# Altium schematic sheet 01_Power.SchDoc
size A3; SheetNumber: 1; SheetTotal: 6
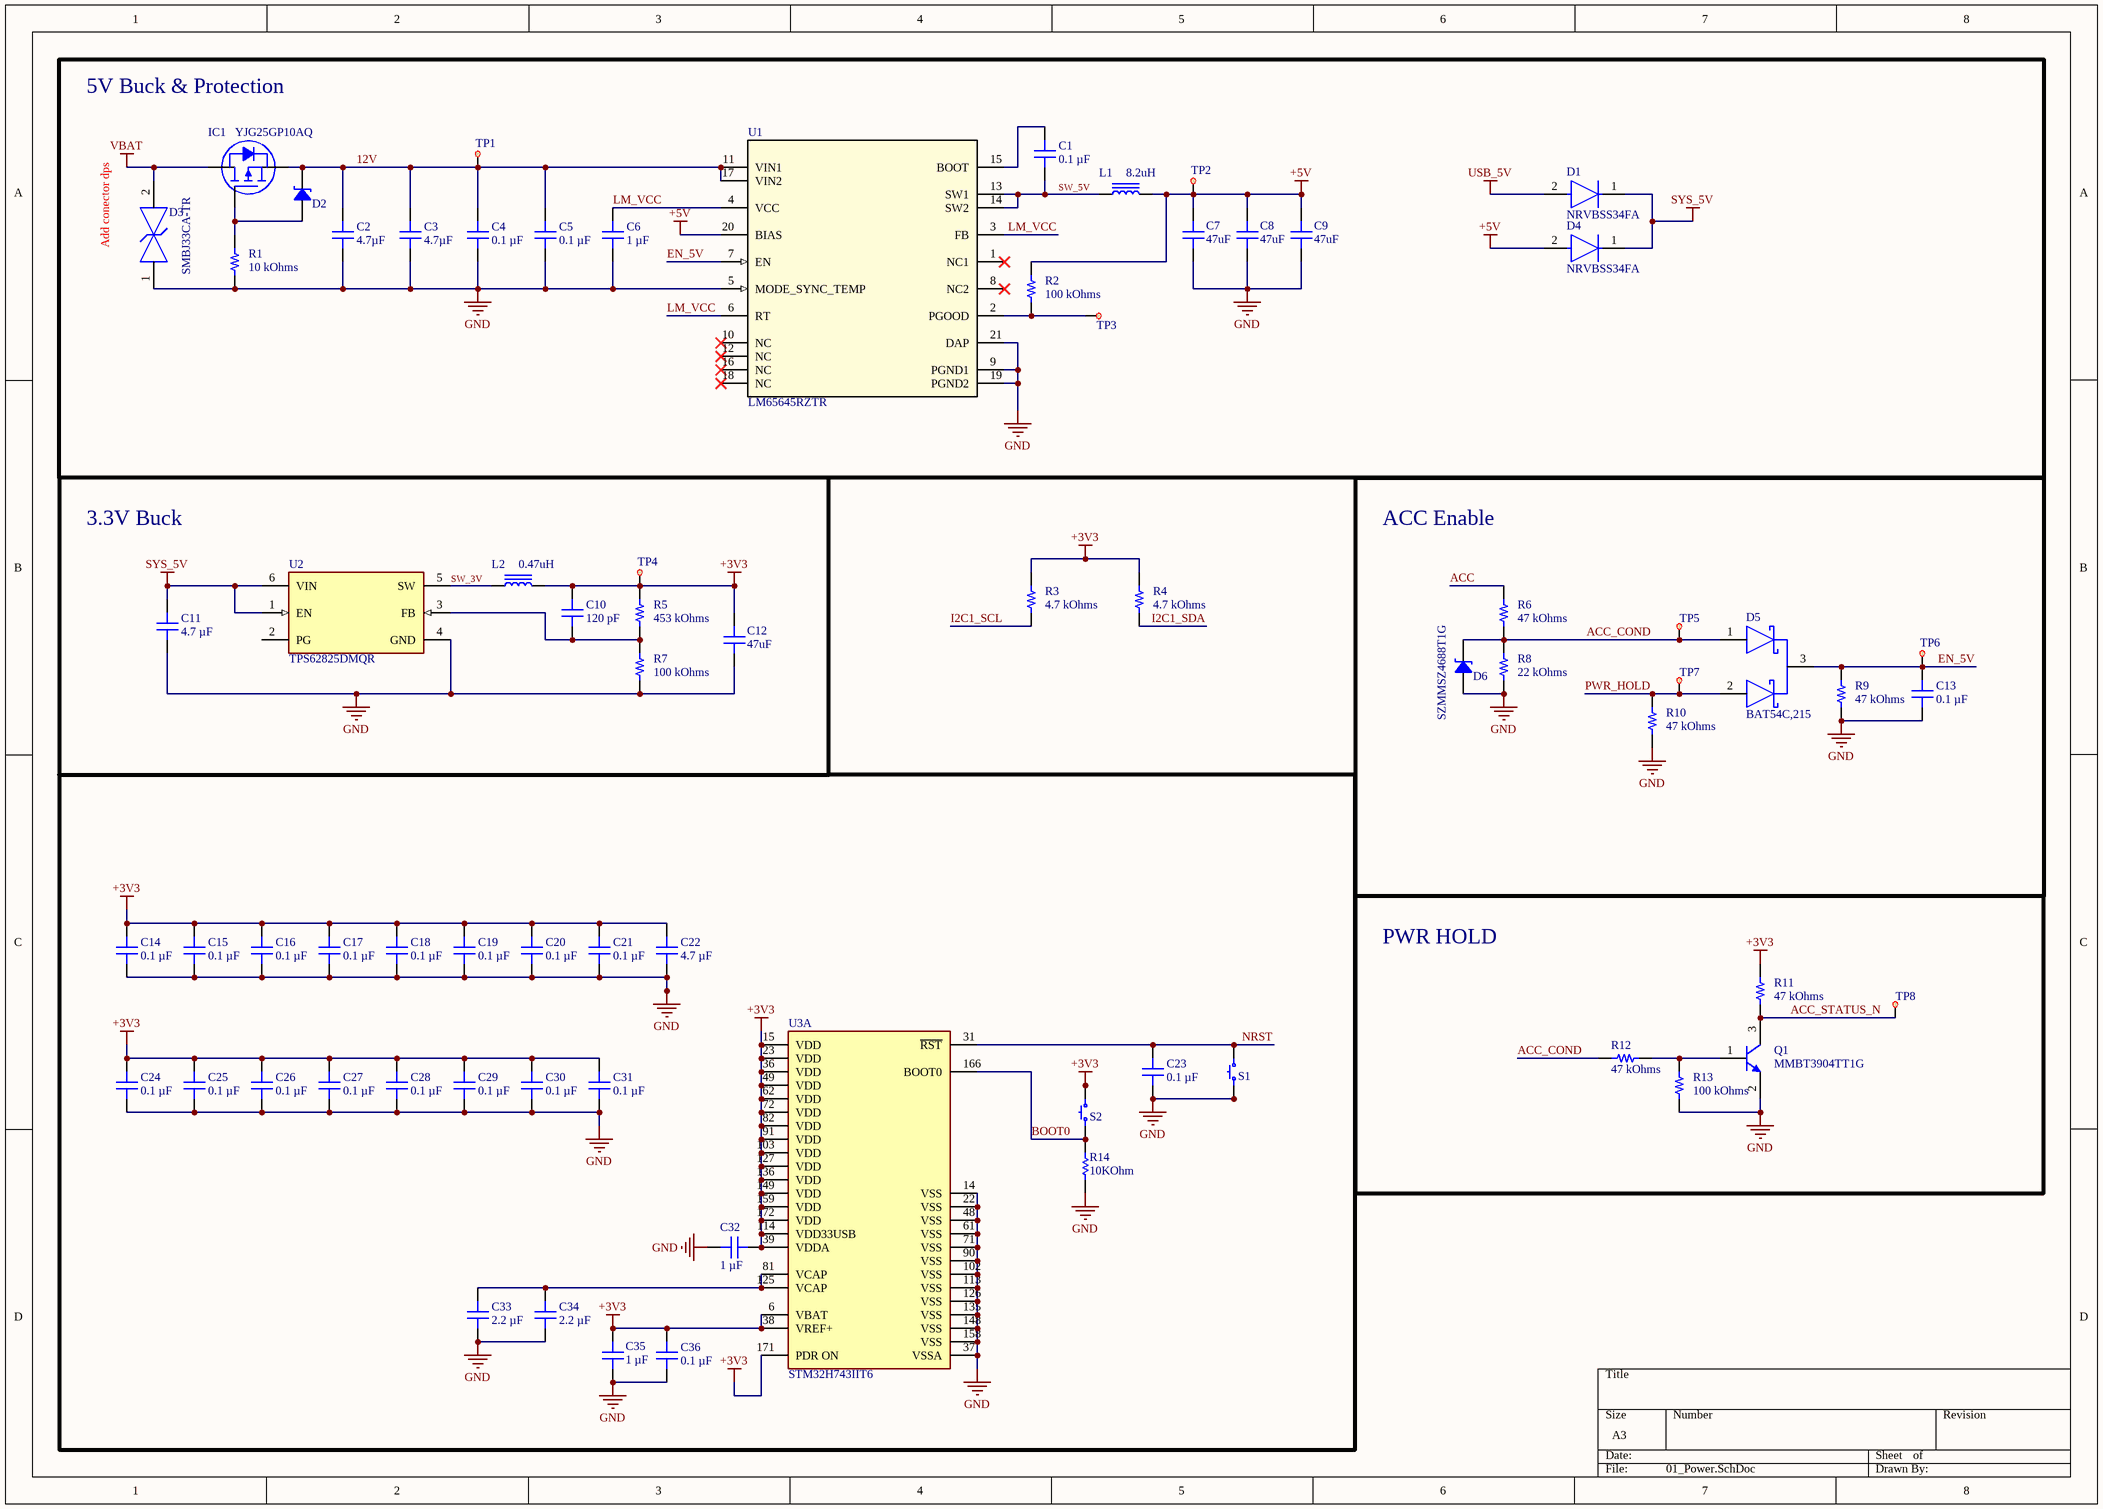
[diagram p0: 01_Power.SchDoc]

## Parts
C1  0.1 µF  [CAP 0402_1005]
C2  4.7µF  [CAP 1210_3225 - 2.8MM]
C3  4.7µF  [CAP 1210_3225 - 2.8MM]
C4  0.1 µF  [CAP 0603_1608]
C5  0.1 µF  [CAP 0603_1608]
C6  1 µF  [CAP 0603_1608]
C7  47uF  [HRE CGA1206X5R476M100NT CAPC3216X180N]
C8  47uF  [HRE CGA1206X5R476M100NT CAPC3216X180N]
C9  47uF  [HRE CGA1206X5R476M100NT CAPC3216X180N]
C10  120 pF  [CAP 0402_1005]
C11  4.7 µF  [CAP 0603_1608]
C12  47uF  [HRE CGA1206X5R476M100NT CAPC3216X180N]
C13  0.1 µF  [CAP 0402_1005]
C14  0.1 µF  [CAP 0201_0603]
C15  0.1 µF  [CAP 0201_0603]
C16  0.1 µF  [CAP 0201_0603]
C17  0.1 µF  [CAP 0201_0603]
C18  0.1 µF  [CAP 0201_0603]
C19  0.1 µF  [CAP 0201_0603]
C20  0.1 µF  [CAP 0201_0603]
C21  0.1 µF  [CAP 0201_0603]
C22  4.7 µF  [CAP 0603_1608]
C23  0.1 µF  [CAP 0201_0603]
C24  0.1 µF  [CAP 0201_0603]
C25  0.1 µF  [CAP 0201_0603]
C26  0.1 µF  [CAP 0201_0603]
C27  0.1 µF  [CAP 0201_0603]
C28  0.1 µF  [CAP 0201_0603]
C29  0.1 µF  [CAP 0201_0603]
C30  0.1 µF  [CAP 0201_0603]
C31  0.1 µF  [CAP 0201_0603]
C32  1 µF  [CAP 0603_1608]
C33  2.2 µF  [CAP 0402_1005]
C34  2.2 µF  [CAP 0402_1005]
C35  1 µF  [CAP 0603_1608]
C36  0.1 µF  [CAP 0201_0603]
D1  NRVBSS34FA  [FP-425AB-MFG]
D2  BZT52C15-TP  [SOD-123]  (value not drawn)
D3  SMBJ33CA-TR  [FP-SMB-CA-MFG]
D4  NRVBSS34FA  [FP-425AB-MFG]
D5  BAT54C,215  [FP-SOT23-MFG]
D6  SZMMSZ4688T1G  [SOD-123]
IC1  YJG25GP10AQ  [YJG25GP10AQ DFN5x6_8L_EP1_P]
L1  8.2uH  [cjiang FXL0630-8R2-M INDP7066X300N]
L2  0.47uH  [INDP2016X100N]
Q1  MMBT3904TT1G  [ON SEMICONDUCTOR SC-75]
R1  10 kOhms  [RES 0805_2012]
R2  100 kOhms  [RES 0402_1005]
R3  4.7 kOhms  [RES 0402_1005]
R4  4.7 kOhms  [RES 0402_1005]
R5  453 kOhms  [RES 0402_1005]
R6  47 kOhms  [RES 0402_1005]
R7  100 kOhms  [RES 0402_1005]
R8  22 kOhms  [RES 0402_1005]
R9  47 kOhms  [RES 0402_1005]
R10  47 kOhms  [RES 0402_1005]
R11  47 kOhms  [RES 0402_1005]
R12  47 kOhms  [RES 0402_1005]
R13  100 kOhms  [RES 0402_1005]
R14  10KOhm  [RESC1005X40X25LL05T05]
S1  PTS810 SJM 250 SMTR LFS  [C&K PTS810]  (value not drawn)
S2  PTS810 SJM 250 SMTR LFS  [C&K PTS810]  (value not drawn)
TP1  TestPoint  [TestPoint]  (value not drawn)  (no BOM)
TP2  TestPoint  [TestPoint]  (value not drawn)  (no BOM)
TP3  TestPoint  [TestPoint]  (value not drawn)  (no BOM)
TP4  TestPoint  [TestPoint]  (value not drawn)  (no BOM)
TP5  TestPoint  [TestPoint]  (value not drawn)  (no BOM)
TP6  TestPoint  [TestPoint]  (value not drawn)  (no BOM)
TP7  TestPoint  [TestPoint]  (value not drawn)  (no BOM)
TP8  TestPoint  [TestPoint]  (value not drawn)  (no BOM)
U1  LM65645RZTR  [RZT0020A-MFG]
U2  TPS62825DMQR  [FP-DMQ0006A-MFG]
U3  STM32H743IIT6  [FP-LQFP176-1T-MFG]  (part A of 3)

## Blocks framed on the sheet
5V Buck & Protection: C1-C9 D1-D4 IC1 L1 R1 R2 TP1-TP3 U1

## Nets
+3V3: C10.2 C12.1 C14.2 C15.2 C16.2 C17.2 C18.2 C19.2 C20.2 C21.2 C22.2 C24.2 C25.2 C26.2 C27.2 C28.2 C29.2 C30.2 C31.2 C32.2 C35.2 C36.2 L2.2 R3.2 R4.2 R5.2 R11.2 S2.3 S2.4 TP4.TP?(TestPoint) U3.6(VBAT) U3.15(VDD) U3.23(VDD) U3.36(VDD) U3.38(VREF+) U3.39(VDDA) U3.49(VDD) U3.62(VDD) U3.72(VDD) U3.82(VDD) U3.91(VDD) U3.103(VDD) U3.114(VDD33USB) U3.127(VDD) U3.136(VDD) U3.149(VDD) U3.159(VDD) U3.171(PDR_ON) U3.172(VDD)
+5V: C7.1 C8.1 C9.1 D4.2(A) L1.2 R2.2 TP2.TP?(TestPoint) U1.20(BIAS)
GND: C2.1 C3.1 C4.1 C5.1 C6.1 C7.2 C8.2 C9.2 C11.1 C12.2 C13.1 C14.1 C15.1 C16.1 C17.1 C18.1 C19.1 C20.1 C21.1 C22.1 C23.1 C24.1 C25.1 C26.1 C27.1 C28.1 C29.1 C30.1 C31.1 C32.1 C33.1 C34.1 C35.1 C36.1 D3.1 D6.1 Q1.2(E) R1.1 R7.1 R8.1 R9.1 R10.1 R13.1 R14.1 S1.1 S1.2 U1.5(MODE_SYNC_TEMP) U1.9(PGND1) U1.19(PGND2) U1.21(DAP) U2.4(GND) U3.14(VSS) U3.22(VSS) U3.37(VSSA) U3.48(VSS) U3.61(VSS) U3.71(VSS) U3.90(VSS) U3.102(VSS) U3.113(VSS) U3.126(VSS) U3.135(VSS) U3.148(VSS) U3.158(VSS)
SYS_5V: C11.2 D1.1(C) D4.1(C) U2.1(EN) U2.6(VIN)
USB_5V: D1.2(A)
VBAT: D3.2 IC1.D
12V: C2.2 C3.2 C4.2 C5.2 D2.2 IC1.S TP1.TP?(TestPoint) U1.11(VIN1) U1.17(VIN2)
ACC: R6.2
ACC_COND: D5.1(1_ANODE) D6.2 R6.1 R8.2 R12.2 TP5.TP?(TestPoint)
ACC_STATUS_N: Q1.3(C) R11.1 TP8.TP?(TestPoint)
BOOT0: R14.2 S2.1 S2.2 U3.166(BOOT0)
EN_5V: C13.2 D5.3(COMMON_CATHODE) R9.2 TP6.TP?(TestPoint) U1.7(EN)
I2C1_SCL: R3.1
I2C1_SDA: R4.1
LM_VCC: C6.2 U1.3(FB) U1.4(VCC) U1.6(RT)
NRST: C23.2 S1.3 S1.4 U3.31(~{RST})
PWR_HOLD: D5.2(2_ANODE) R10.2 TP7.TP?(TestPoint)
SW_3V: L2.1 U2.5(SW)
SW_5V: C1.1 L1.1 U1.13(SW1) U1.14(SW2)
NetC1_2: C1.2 U1.15(BOOT)
NetC10_1: C10.1 R5.1 R7.2 U2.3(FB)
NetC33_2: C33.2 C34.2 U3.81(VCAP) U3.125(VCAP)
NetD2_1: D2.1 IC1.G R1.2
NetQ1_1: Q1.1(B) R12.1 R13.2
NetR2_1: R2.1 TP3.TP?(TestPoint) U1.2(PGOOD)

Not connected (* = marked no-connect by the designer): U1 1(NC1)* 8(NC2)* 10(NC)* 12(NC)* 16(NC)* 18(NC)*; U2 2(PG)

## Notes on the sheet
- (near D3) Add conector dps
- 3.3V Buck
- ACC Enable
- PWR HOLD

## Library data of the parts
C1 C13 = CL05B104KO5NNNC: CAP CER 0.1UF 16V X7R 0402; Manufacturer: Samsung Electro-Mechanics; id: 1479; Tolerance: ±10%; Part Number: CL05B104KO5NNNC; Value: 0.1 µF; Temperature Coefficient: X7R; Supplier Part Number 1: 1276-1001-1-ND; ComponentLink2Description: DigiKey Link; ComponentLink1URL: http://www.samsungsem.com/kr/support/product-search/mlcc/CL05B104KO5NNNC.jsp; PartId: 6066; Supplier 1: DigiKey; Series: CL; LastUpdated: 2023-01-03T20:04:06.380; Part Status: Active; Capacitance: 0.1 µF; Device Package: 0402 (1005 Metric); Thickness (Max): 0.022" (0.55mm); Voltage - Rated: 16V; Minimum Order: 1; Packaging: CutTape; Applications: General Purpose; Package / Case: 0402 (1005 Metric); ComponentLink1Description: Datasheet; Price: 0.01; ComponentLink2URL: https://www.digikey.com/en/products/detail/samsung-electro-mechanics/CL05B104KO5NNNC/3886659; Lifecycle Status: Active; Operating Temperature: -55°C ~ 125°C; Size / Dimension: 0.039" L x 0.020" W (1.00mm x 0.50mm); Mounting Type: Surface Mount, MLCC
C2 C3 = 12101C475K4T2A: CAP CER 4.7UF 100V X7R 1210; Manufacturer: AVX Corporation; id: 35; Tolerance: ±10%; Part Number: 12101C475K4T2A; Value: 4.7µF; Temperature Coefficient: X7R; Supplier Part Number 1: 478-12147-1-ND; ComponentLink2Description: DigiKey Link; ComponentLink1URL: http://datasheets.avx.com/AutoMLCC.pdf; PartId: 23695; Supplier 1: DigiKey; Series: -; LastUpdated: 2020-09-02T01:10:52.300; Part Status: Active; Capacitance: 4.7µF; Device Package: 1210 (3225 Metric); Ratings: AEC-Q200; Thickness (Max): 0.110" (2.79mm); Voltage - Rated: 100V; Minimum Order: 1; Packaging: TapeAndReel; Applications: Automotive; Package / Case: 1210 (3225 Metric); ComponentLink1Description: Datasheet; Price: 0.30; ComponentLink2URL: http://digikey.com/product-detail/en/avx-corporation/12101C475K4T2A/478-12147-1-ND/9374716; Lifecycle Status: Active; Operating Temperature: -55°C ~ 125°C; Size / Dimension: 0.130" L x 0.098" W (3.30mm x 2.50mm); Mounting Type: Surface Mount, MLCC
C4 C5 = CL10B104KC8NNNC: CAP CER 0.1UF 100V X7R 0603; Manufacturer: Samsung Electro-Mechanics; id: 2850; Tolerance: ±10%; Part Number: CL10B104KC8NNNC; Value: 0.1 µF; Temperature Coefficient: X7R; Supplier Part Number 1: 1276-6807-1-ND; ComponentLink2Description: DigiKey Link; ComponentLink1URL: http://www.samsungsem.com/kr/support/product-search/mlcc/CL10B104KC8NNNC.jsp; PartId: 14045; Supplier 1: DigiKey; Series: CL; LastUpdated: 2023-01-03T20:07:14.813; Part Status: Active; Capacitance: 0.1 µF; Device Package: 0603 (1608 Metric); Thickness (Max): 0.035" (0.90mm); Voltage - Rated: 100V; Minimum Order: 1; Packaging: TapeAndReel; Applications: General Purpose; Package / Case: 0603 (1608 Metric); ComponentLink1Description: Datasheet; Price: 0.01; ComponentLink2URL: https://www.digikey.com/en/products/detail/samsung-electro-mechanics/CL10B104KC8NNNC/5961291; Lifecycle Status: Active; Operating Temperature: -55°C ~ 125°C; Size / Dimension: 0.063" L x 0.031" W (1.60mm x 0.80mm); Mounting Type: Surface Mount, MLCC
C6 C32 C35 = C0603C105K4RACAUTO: CAP CER 1UF 16V X7R 0603; Manufacturer: KEMET; id: 14; Tolerance: ±10%; Part Number: C0603C105K4RACAUTO; Value: 1 µF; Temperature Coefficient: X7R; Supplier Part Number 1: 399-17704-2-ND; ComponentLink2Description: DigiKey Link; ComponentLink1URL: https://api.kemet.com/component-edge/download/datasheet/C0603C105K4RACAUTO.pdf; PartId: 2179; Supplier 1: DigiKey; Series: SMD Auto X7R; LastUpdated: 2023-01-03T20:07:48.393; Part Status: Active; Capacitance: 1 µF; Device Package: 0603 (1608 Metric); Ratings: AEC-Q200; Thickness (Max): 0.037" (0.95mm); Voltage - Rated: 16V; Minimum Order: 0; Applications: Automotive, Bypass, Decoupling; Package / Case: 0603 (1608 Metric); ComponentLink1Description: Datasheet; Price: 0; ComponentLink2URL: https://www.digikey.com/en/products/detail/kemet/C0603C105K4RACAUTO/8635831; Lifecycle Status: Active; Operating Temperature: -55°C ~ 125°C; Size / Dimension: 0.063" L x 0.031" W (1.60mm x 0.80mm); Mounting Type: Surface Mount, MLCC
C7-C9 C12 = HRE CGA1206X5R476M100NT: CAP CER 47uF 10V X5R 1206; Value: 47uF
C10 = CC0402FRNPO9BN121: CAP CER 120PF 50V C0G/NPO 0402; Manufacturer: Yageo; id: 310; Temperature Coefficient: C0G, NP0; Tolerance: ±1%; Part Number: CC0402FRNPO9BN121; Value: 120 pF; Supplier Part Number 1: 311-3727-1-ND; ComponentLink2Description: DigiKey Link; ComponentLink1URL: https://www.yageo.com/upload/media/product/productsearch/datasheet/mlcc/UPY-GP_NP0_16V-to-50V_17.pdf; PartId: 2100; Supplier 1: DigiKey; Series: CC; LastUpdated: 2023-01-03T20:04:17.640; Part Status: Active; Capacitance: 120 pF; Device Package: 0402 (1005 Metric); Thickness (Max): 0.022" (0.55mm); Voltage - Rated: 50V; Minimum Order: 1; Packaging: TapeAndReel; Applications: General Purpose; Package / Case: 0402 (1005 Metric); ComponentLink1Description: Datasheet; Price: 0.01; ComponentLink2URL: https://www.digikey.com/en/products/detail/yageo/CC0402FRNPO9BN121/5883232; Lifecycle Status: Active; Operating Temperature: -55°C ~ 125°C; Size / Dimension: 0.039" L x 0.020" W (1.00mm x 0.50mm); Mounting Type: Surface Mount, MLCC
C11 C22 = CL10A475KP8NNNC: CAP CER 4.7UF 10V X5R 0603; Manufacturer: Samsung Electro-Mechanics; id: 830; Tolerance: ±10%; Part Number: CL10A475KP8NNNC; Value: 4.7 µF; Temperature Coefficient: X5R; Supplier Part Number 1: 1276-1044-1-ND; ComponentLink2Description: DigiKey Link; ComponentLink1URL: http://www.samsungsem.com/kr/support/product-search/mlcc/CL10A475KP8NNNC.jsp; PartId: 5671; Supplier 1: DigiKey; Series: CL; LastUpdated: 2023-01-03T20:07:38.840; Part Status: Active; Capacitance: 4.7 µF; Device Package: 0603 (1608 Metric); Thickness (Max): 0.035" (0.90mm); Voltage - Rated: 10V; Minimum Order: 1; Packaging: TapeAndReel; Applications: General Purpose; Package / Case: 0603 (1608 Metric); ComponentLink1Description: Datasheet; Price: 0.01; ComponentLink2URL: https://www.digikey.com/en/products/detail/samsung-electro-mechanics/CL10A475KP8NNNC/3886702; Lifecycle Status: Active; Operating Temperature: -55°C ~ 85°C; Size / Dimension: 0.063" L x 0.031" W (1.60mm x 0.80mm); Mounting Type: Surface Mount, MLCC
C14-C21 C23-C31 C36 = CC0201KRX7R5BB104: CAP CER 0.1UF 6.3V X7R 0201; Manufacturer: Yageo; id: 2076; Tolerance: ±10%; Part Number: CC0201KRX7R5BB104; Value: 0.1 µF; Temperature Coefficient: X7R; Supplier Part Number 1: 13-CC0201KRX7R5BB104CT-ND; ComponentLink2Description: DigiKey Link; ComponentLink1URL: https://www.yageo.com/upload/media/product/productsearch/datasheet/mlcc/UPY-GPHC_X7R_6.3V-to-50V_20.pdf; PartId: 44620; Supplier 1: DigiKey; Series: CC; LastUpdated: 2023-01-03T20:00:55.290; Part Status: Active; Capacitance: 0.1 µF; Device Package: 0201 (0603 Metric); Thickness (Max): 0.013" (0.33mm); Voltage - Rated: 6.3V; Minimum Order: 1; Packaging: TapeAndReel; Applications: General Purpose; Package / Case: 0201 (0603 Metric); ComponentLink1Description: Datasheet; Price: 0.01; ComponentLink2URL: https://www.digikey.com/en/products/detail/yageo/CC0201KRX7R5BB104/12698853; Lifecycle Status: Active; Operating Temperature: -55°C ~ 125°C; Size / Dimension: 0.024" L x 0.012" W (0.60mm x 0.30mm); Mounting Type: Surface Mount, MLCC
C33 C34 = GRM155Z71A225KE01D: CAP CER 2.2UF 10V X7R 0402; Manufacturer: Murata Electronics; id: 5073; Tolerance: ±10%; Part Number: GRM155Z71A225KE01D; Value: 2.2 µF; Temperature Coefficient: X7R; Supplier Part Number 1: 490-GRM155Z71A225KE01DCT-ND; ComponentLink2Description: DigiKey Link; ComponentLink1URL: https://search.murata.co.jp/Ceramy/image/img/A01X/G101/ENG/GRM155Z71A225KE01-01.pdf; PartId: 40418; Supplier 1: DigiKey; Series: GRM; LastUpdated: 2023-01-03T20:03:24.830; Part Status: Active; Capacitance: 2.2 µF; Device Package: 0402 (1005 Metric); Thickness (Max): 0.026" (0.65mm); Voltage - Rated: 10V; Minimum Order: 1; Packaging: TapeAndReel; Applications: General Purpose; Package / Case: 0402 (1005 Metric); ComponentLink1Description: Datasheet; Price: 0.03; ComponentLink2URL: https://www.digikey.com/en/products/detail/murata-electronics/GRM155Z71A225KE01D/13905066; Lifecycle Status: Active; Operating Temperature: -55°C ~ 125°C; Size / Dimension: 0.039" L x 0.020" W (1.00mm x 0.50mm); Mounting Type: Surface Mount, MLCC
D1 D4 = CMP-00278-103808874-1: NRVBSS34FA Schottky Barrier Rectifier Diode 40V 3A 2-Pin SOD−123FL T/R; Manufacturer Lifecycle Status: ACTIVE; Max Junction Temperature (Tj): 125°C; Capacitance: 152pF; Peak Reverse Current: 500µA; Max Forward Surge Current (Ifsm): 80A; RoHS: Compliant; Forward Current: 3A; Height: 1.43mm; Max Operating Temperature: 125°C; Min Operating Temperature: -55°C; Lifecycle Status: Production; Max Repetitive Reverse Voltage (Vrrm): 40V; Reverse Voltage: 40V; NexarPartId: 103808874
D2 = BZT52C15-TP: DIODE ZENER 15V 200MW SOD123; Manufacturer: Micro Commercial Co; id: 1630; Tolerance: ±6%; Voltage - Forward (Vf) (Max) @ If: 900 mV @ 10 mA; Impedance (Max) (Zzt): 30 Ohms; Current - Reverse Leakage @ Vr: 100 nA @ 10.5 V; Part Number: BZT52C15-TP; Supplier Part Number 1: 353-BZT52C15-TPCT-ND; Supplier Device Package: SOD-123; ComponentLink1Description: Datasheet; ComponentLink2URL: https://www.digikey.com/en/products/detail/micro-commercial-co/BZT52C15-TP/806056; ComponentLink1URL: https://www.mccsemi.com/pdf/Products/BZT52C2V4~BZT52C43(500mW)(SOD-123).pdf; Supplier 1: DigiKey; Power - Max: 200 mW; Series: -; Part Status: Active; ComponentLink2Description: DigiKey Link; Packaging: TapeAndReel; Minimum Order: 1; Package / Case: SOD-123; PartId: 2405; Lifecycle Status: Active; LastUpdated: 2023-01-02T20:54:22.343; Operating Temperature: -65°C ~ 150°C; Mounting Type: Surface Mount; Price: 0.02; Voltage - Zener (Nom) (Vz): 15 V
D3 = CMP-12225-000040-1: TVS DIODE 33V 69.7V SMB; Manufacturer: STMicroelectronics; Direction: Bidirectional; Peak Pulse Current: 11.8A; Peak Pulse Power: 600W; Clamping Voltage: 53.3V; Breakdown Voltage: 36.7V; Number Of Channels: 1; Standoff Height: 0.05mm; Max Junction Temp: +150°C; Lead Free: Yes; Device Class L1: Circuit Protection; Device Class L3: unset; Mouser Description: TVS Diodes - Transient Voltage Suppressors 600W 33V Bidirect; Device Class L2: TVS Diodes; Temperature Range High: +150°C; Temperature: -55°C to +150°C; Temperature Range Low: -55°C; Octopart: https://octopart.com/smbj33ca-tr-stmicroelectronics-347069; Manufacturer Part Number: SMBJ33CA-TR; Automotive: No; ComponentLink2URL: https://www.st.com/resource/en/datasheet/smbj.pdf; RoHS: TRUE; Package: SMB-CA; Category: Diode; ComponentLink2Description: Datasheet; Height: 2.65mm; Reverse Standoff Voltage: 33V; Digikey Description: TVS DIODE 33V 69.7V SMB
D5 = CMP-14398-000007-1: DIODE ARRAY SCHOTTKY 30V SOT23; Manufacturer: Nexperia; Automotive Grade: Grade 0; Peak Reverse Current: 2uA; Forward Current: 200mA; Max Surge Forward Current: 600mA; Value: 10pF; Max Junction Temp: +150°C; Lead Free: Yes; Automotive: Yes; Device Class L1: Discrete Semiconductors; Digikey Description: DIODE ARRAY SCHOTTKY 30V SOT23; Reverse Voltage: 30V; ComponentLink2URL: https://assets.nexperia.com/documents/data-sheet/BAT54_SER.pdf; Device Class L2: Diodes; Category: Diode; Octopart: https://octopart.com/bat54c%2C215-nexperia-78738945; Package: SOT23; Mouser Description: Schottky Diodes, Rectifiers - Arrays SOT-23 (TO-236AB) 30V 200mA (DC) Surface Mount; RoHS: TRUE; Manufacturer Part Number: BAT54C,215; Temperature: to +150°C; Ambient Temperature Range Low: -55°C; Height: 1.1mm; Device Class L3: Schottky Diodes; Temperature Range High: +150°C; Footprint Url: https://assets.nexperia.com/documents/outline-drawing/SOT23.pdf; Capacitance: 10pF; Ambient Temperature Range High: +150°C; Ipc Land Pattern Name: SOT95P230X100-3; ComponentLink2Description: Datasheet
D6 = SZMMSZ4688T1G: DIODE ZENER 4.7V 500MW SOD123; Manufacturer: ON Semiconductor; id: 902; Tolerance: ±5%; Voltage - Forward (Vf) (Max) @ If: 900mV @ 10mA; Current - Reverse Leakage @ Vr: 10µA @ 3V; Part Number: SZMMSZ4688T1G; Supplier Part Number 1: SZMMSZ4688T1GOSCT-ND; Supplier Device Package: SOD-123; ComponentLink1Description: Datasheet; ComponentLink2URL: http://digikey.com/product-detail/en/on-semiconductor/SZMMSZ4688T1G/SZMMSZ4688T1GOSCT-ND/5969244; ComponentLink1URL: http://www.onsemi.com/pub/Collateral/MMSZ4678T1-D.PDF; Supplier 1: DigiKey; Power - Max: 500mW; Series: Automotive, AEC-Q101; Part Status: Active; ComponentLink2Description: DigiKey Link; Packaging: TapeAndReel; Minimum Order: 1; Package / Case: SOD-123; PartId: 1677; Lifecycle Status: Active; LastUpdated: 2023-01-02T20:54:29.747; Operating Temperature: -55°C ~ 150°C; Mounting Type: Surface Mount; Price: 0.05; Voltage - Zener (Nom) (Vz): 4.7V
IC1 = YJG25GP10AQ: MOSFET P-CH 100V 25A PDFN5060-8L
L1 = cjiang FXL0630-8R2-M: FIXED IND 8.2uH 5A 60mΩ SMD,6.6x7mm; Value: 8.2uH
L2 = FTC201610SR47MBCA: FIXED IND 0.47uH 5.5A 22mΩ SMD,1.6x2mm; Value: 0.47uH
Q1 = MMBT3904TT1G: TRANS NPN 40V 0.2A SOT416; Manufacturer: ON Semiconductor; id: 34; Current - Collector (Ic) (Max): 200mA; Power - Max: 300mW; DC Current Gain (Hfe) (Min) @ Ic, Vce: 100 @ 10mA, 1V; Vce Saturation (Max) @ Ib, Ic: 300mV @ 5mA, 50mA; Frequency - Transition: 300MHz; Part Number: MMBT3904TT1G; Supplier Part Number 1: MMBT3904TT1GOSCT-ND; Supplier Device Package: SC-75, SOT-416; ComponentLink1Description: Datasheet; ComponentLink2URL: http://digikey.com/product-detail/en/on-semiconductor/MMBT3904TT1G/MMBT3904TT1GOSCT-ND/1139815; ComponentLink1URL: https://www.onsemi.com/pub/Collateral/MMBT3904TT1-D.PDF; Supplier 1: DigiKey; Series: -; Part Status: Active; ComponentLink2Description: DigiKey Link; Packaging: TapeAndReel; Minimum Order: 1; Transistor Type: NPN; Voltage - Collector Emitter Breakdown (Max): 40V; Package / Case: SC-75, SOT-416; PartId: 34; Lifecycle Status: Active; LastUpdated: 2023-01-02T21:11:02.333; Operating Temperature: -55°C ~ 150°C (TJ); Mounting Type: Surface Mount; Price: 0.02
R1 = RNCP0805FTD10K0: RES 10K OHM 1% 1/4W 0805; Manufacturer: Stackpole Electronics Inc; id: 164; Temperature Coefficient: ±100ppm/°C; Power (Watts): 0.25W, 1/4W; Part Number: RNCP0805FTD10K0; Height - Seated (Max): 0.025" (0.65mm); Supplier Part Number 1: RNCP0805FTD10K0CT-ND; Supplier Device Package: 0805; ComponentLink1Description: Datasheet; ComponentLink2URL: https://www.digikey.com/en/products/detail/stackpole-electronics-inc/RNCP0805FTD10K0/2240262; Features: Anti-Sulfur; ComponentLink1URL: https://www.seielect.com/catalog/sei-rncp.pdf; Composition: Thin Film; Tolerance: ±1%; Supplier 1: DigiKey; Series: RNCP; Part Status: Active; ComponentLink2Description: DigiKey Link; Device Package: 0805 (2012 Metric); Packaging: TapeAndReel; Minimum Order: 1; Package / Case: 0805 (2012 Metric); PartId: 28021; Lifecycle Status: Active; LastUpdated: 2023-01-02T20:44:50.960; Operating Temperature: -55°C ~ 155°C; Number Of Terminations: 2; Value: 10 kOhms; Size / Dimension: 0.079" L x 0.049" W (2.00mm x 1.25mm); Price: 0.01; Resistance: 10 kOhms
R2 R7 R13 = TNPW0402100KBETD: RES 100K OHM 0.1% 1/16W 0402; Manufacturer: Vishay Dale; id: 276; Temperature Coefficient: ±25ppm/°C; Power (Watts): 0.063W, 1/16W; Part Number: TNPW0402100KBETD; Height - Seated (Max): 0.016" (0.40mm); Supplier Part Number 1: 541-3558-1-ND; Supplier Device Package: 0402; ComponentLink1Description: Datasheet; ComponentLink2URL: https://www.digikey.com/en/products/detail/vishay-dale/TNPW0402100KBETD/1613336; Features: Military; ComponentLink1URL: http://www.vishay.com/docs/31006/tnpw.pdf; Composition: Thin Film; Tolerance: ±0.1%; Supplier 1: DigiKey; Series: TNPW; Part Status: Active; ComponentLink2Description: DigiKey Link; Device Package: 0402 (1005 Metric); Packaging: TapeAndReel; Minimum Order: 1; Package / Case: 0402 (1005 Metric); PartId: 3017; Lifecycle Status: Active; LastUpdated: 2023-01-02T20:21:49.443; Operating Temperature: -55°C ~ 125°C; Number Of Terminations: 2; Value: 100 kOhms; Size / Dimension: 0.039" L x 0.020" W (1.00mm x 0.50mm); Price: 0.26; Resistance: 100 kOhms
R3 R4 = RC0402FR-074K7L: RES 4.7K OHM 1% 1/16W 0402; Manufacturer: Yageo; id: 7819; Temperature Coefficient: ±100ppm/°C; Power (Watts): 0.063W, 1/16W; Part Number: RC0402FR-074K7L; Height - Seated (Max): 0.016" (0.40mm); Supplier Part Number 1: 311-4.7KLRCT-ND; Supplier Device Package: 0402; ComponentLink1Description: Datasheet; ComponentLink2URL: https://www.digikey.com/en/products/detail/yageo/RC0402FR-074K7L/2827563; Features: Moisture Resistant; ComponentLink1URL: https://www.yageo.com/upload/media/product/productsearch/datasheet/rchip/PYu-RC_Group_51_RoHS_L_10.pdf; Composition: Thick Film; Tolerance: ±1%; Supplier 1: DigiKey; Series: RC_L; Part Status: Active; ComponentLink2Description: DigiKey Link; Device Package: 0402 (1005 Metric); Packaging: CutTape; Minimum Order: 1; Package / Case: 0402 (1005 Metric); PartId: 17603; Lifecycle Status: Active; LastUpdated: 2023-01-02T20:20:45.723; Operating Temperature: -55°C ~ 155°C; Number Of Terminations: 2; Value: 4.7 kOhms; Size / Dimension: 0.039" L x 0.020" W (1.00mm x 0.50mm); Price: 0.01; Resistance: 4.7 kOhms
R5 = CRCW0402453KFKED: RES SMD 453K OHM 1% 1/16W 0402; Manufacturer: Vishay Dale; id: 4156; Temperature Coefficient: ±100ppm/°C; Power (Watts): 0.063W, 1/16W; Part Number: CRCW0402453KFKED; Height - Seated (Max): 0.016" (0.40mm); Supplier Part Number 1: 541-453KLCT-ND; Supplier Device Package: 0402; ComponentLink1Description: Datasheet; ComponentLink2URL: https://www.digikey.com/en/products/detail/vishay-dale/CRCW0402453KFKED/1178309; Features: Automotive AEC-Q200; ComponentLink1URL: http://www.vishay.com/docs/20035/dcrcwe3.pdf; Composition: Thick Film; Tolerance: ±1%; Supplier 1: DigiKey; Series: CRCW; Part Status: Active; ComponentLink2Description: DigiKey Link; Device Package: 0402 (1005 Metric); Packaging: CutTape; Ratings: AEC-Q200; Minimum Order: 1; Package / Case: 0402 (1005 Metric); PartId: 10428; Lifecycle Status: Active; LastUpdated: 2023-01-02T20:21:16.597; Operating Temperature: -55°C ~ 155°C; Number Of Terminations: 2; Value: 453 kOhms; Size / Dimension: 0.039" L x 0.020" W (1.00mm x 0.50mm); Price: 0.01; Resistance: 453 kOhms
R6 R9-R12 = RMCF0402FT47K0: RES 47K OHM 1% 1/16W 0402; Manufacturer: Stackpole Electronics Inc; id: 1346; Temperature Coefficient: ±100ppm/°C; Power (Watts): 0.063W, 1/16W; Part Number: RMCF0402FT47K0; Height - Seated (Max): 0.016" (0.40mm); Supplier Part Number 1: RMCF0402FT47K0CT-ND; Supplier Device Package: 0402; ComponentLink1Description: Datasheet; ComponentLink2URL: https://www.digikey.com/en/products/detail/stackpole-electronics-inc/RMCF0402FT47K0/1714749; Features: Automotive AEC-Q200; ComponentLink1URL: https://www.seielect.com/catalog/sei-rmcf_rmcp.pdf; Composition: Thick Film; Tolerance: ±1%; Supplier 1: DigiKey; Series: RMCF; Part Status: Active; ComponentLink2Description: DigiKey Link; Device Package: 0402 (1005 Metric); Packaging: CutTape; Ratings: AEC-Q200; Minimum Order: 1; Package / Case: 0402 (1005 Metric); PartId: 4957; Lifecycle Status: Active; LastUpdated: 2023-01-02T20:21:41.127; Operating Temperature: -55°C ~ 155°C; Number Of Terminations: 2; Value: 47 kOhms; Size / Dimension: 0.039" L x 0.020" W (1.00mm x 0.50mm); Price: 0.01; Resistance: 47 kOhms
R8 = RT0402BRD0722KL: RES SMD 22K OHM 0.1% 1/16W 0402; Manufacturer: Yageo; id: 1014; Temperature Coefficient: ±25ppm/°C; Power (Watts): 0.063W, 1/16W; Part Number: RT0402BRD0722KL; Height - Seated (Max): 0.014" (0.35mm); Supplier Part Number 1: YAG4210CT-ND; Supplier Device Package: 0402; ComponentLink1Description: Datasheet; ComponentLink2URL: https://www.digikey.com/en/products/detail/yageo/RT0402BRD0722KL/1069136; ComponentLink1URL: https://www.yageo.com/upload/media/product/productsearch/datasheet/rchip/PYu-RT_1-to-0.01_RoHS_L_11.pdf; Composition: Thin Film; Tolerance: ±0.1%; Supplier 1: DigiKey; Series: RT; Part Status: Active; ComponentLink2Description: DigiKey Link; Device Package: 0402 (1005 Metric); Packaging: TapeAndReel; Minimum Order: 1; Package / Case: 0402 (1005 Metric); PartId: 4575; Lifecycle Status: Active; LastUpdated: 2023-01-02T20:21:43.577; Operating Temperature: -55°C ~ 155°C; Number Of Terminations: 2; Value: 22 kOhms; Size / Dimension: 0.039" L x 0.020" W (1.00mm x 0.50mm); Price: 0.04; Resistance: 22 kOhms
R14 = CMP-2000-07588-1: Chip Resistor, 10 KOhm, +/- 1%, 0.1 W, -55 to 155 degC, 0402 (1005 Metric), RoHS, Tape and Reel; Manufacturer: Panasonic; Power Rating: 100mW; Voltage Rating: 50V; Case\/Package: 0402; Temperature Coefficient: 100ppm\/degreesC; RoHSCompliant: True; Lead Free: LeadFree; Package Quantity: 1; Contact Plating: Tin; Resistance: 10KOhm; Length: 1mm; Radiation Hardening: No; REACH SVHC: NoSVHC; Max Operating Temperature: 155degC; Depth: 0.5mm; Case Code (Imperial): 0402; Military Standard: Not; Package Description: 2-Pin Surface Mount Device, Body 1 x 0.5 mm; Termination: SMD/SMT; Case Code (Metric): 1005; Height: 0.35mm; Packaging: TapeandReel; Voltage Rating (DC): 50V; Package Reference: 402; Number of Pins: 2; Tolerance: 1%; Mounting Technology: SurfaceMount; Width: 0.02inch; Mount: SurfaceMount; Datasheet URL: https://industrial.panasonic.com/cdbs/www-data/pdf/RDA0000/AOA0000C304.pdf; Composition: ThickFilm; Datasheet Version: 02/2017; Manufacturer URL: http://www.panasonic.com/; Max Power Dissipation: 100mW; Number of Terminations: 2; Min Operating Temperature: -55degC
S1 S2 = PTS810 SJM 250 SMTR LFS: SWITCH TACTILE SPST-NO 0.05A 16V; Manufacturer: C&K; id: 32; Switch Function: Off-Mom; Contact Rating @ Voltage: 0.05A @ 16VDC; Outline: 4.20mm x 3.20mm; Actuator Height Off Pcb, Vertical: 2.50mm; Actuator Orientation: Top Actuated; Actuator Type: Oval Button; Illumination: Non-Illuminated; Operating Force: 160gf; Part Number: PTS810 SJM 250 SMTR LFS; Supplier Part Number 1: CKN10502CT-ND; ComponentLink1Description: Datasheet; ComponentLink2URL: http://digikey.com/product-detail/en/c-k/PTS810-SJM-250-SMTR-LFS/CKN10502CT-ND/4176673; ComponentLink1URL: https://dznh3ojzb2azq.cloudfront.net/products/Tactile/PTS810/documents/datasheet.pdf; Supplier 1: DigiKey; Series: PTS810; Part Status: Active; ComponentLink2Description: DigiKey Link; Packaging: TapeAndReel; Minimum Order: 1; Lifecycle Status: Active; LastUpdated: 2020-04-09T10:00:13.177; Termination Style: J Lead; Operating Temperature: -40°C ~ 85°C; Circuit: SPST-NO; Mounting Type: Surface Mount; Price: 0.16
U1 = LM65645RZTR: 3V to 65V, 4.5A synchronous step-down converter optimized for power density and low EMI 20-WQFN-FCRLF -40 to 150; Manufacturer 1: Texas Instruments; TYPE: TYPE; RefDes: RefDes; Copyright: Copyright (C) 2025 Ultra Librarian. All rights reserved.; Manufacturer Part Number 1: LM65645RZTR
U2 = CMP-04918-000438-1: IC REG BUCK ADJUSTABLE 2A 6VSON; Max Input Voltage: 5.5V; Number of Outputs: 1; Min Output Voltage: 600mV; Switching Frequency: 2.2MHz; Synchronous Rectifier: Yes; Max Output Voltage: 4V; Min Input Voltage: 2.4V; Output Configuration: Positive; Max Operating Temperature: 125°C; Output Type: Adjustable; Output Current: 2A; Mount: Surface Mount; Min Operating Temperature: -40°C; Number of Pins: 6; RoHS Compliant: Yes; Packaging: Tape and Reel
U3 = CMP-12105-000078-1: IC MCU 32BIT 2MB FLASH 176LQFP; Manufacturer: STMicroelectronics; Number Of I/Os: 140; Number Of Pwm Channels: 2; Standoff Height: 0.05mm; Number Of Uart Channels: 9; Frequency: 400MHz; Core Architecture: ARM Cortex-M7; Ram Size: 1MBytes; Max Supply Voltage: 3.6V; Number Of Timers/Counters: 20; Min Supply Voltage: 1.62V; Number Of I2C Channels: 4; Number Of Cores: 1; Max Junction Temp: +125°C; Data Bus Width: 32bits; Memory Size: 2MBytes; Number Of Adc Channels: 36; Number Of Spi Channels: 6; Interface: I2C,SPI,UART,USART,CAN,USB,LIN,IrDA,Ethernet,SMBus,Other; Number Of A/D Converters: 3; Digikey Description: IC MCU 32BIT 2MB FLASH 176LQFP; Temperature: -40°C to +125°C; Package: LQFP176-1T; RoHS: TRUE; Memory Type: FLASH; Device Class L3: Microcontrollers; Manufacturer Part Number: STM32H743IIT6; Mouser Description: MCU 32-Bit STM32 ARM Cortex M7 RISC 2MB Flash 1.8V/2.5V/3.3V 176-Pin LQFP Tray; Category: IC; Automotive: No; Ambient Temperature Range High: +85°C; Number Of Usb Channels: 2; ComponentLink2URL: https://www.st.com/resource/en/datasheet/stm32h743ii.pdf; Lead Free: Yes; Ambient Temperature Range Low: -40°C; ComponentLink2Description: Datasheet; Device Class L2: Embedded Processors and Controllers; Octopart: https://octopart.com/stm32h743iit6-stmicroelectronics-76372526; Device Class L1: Integrated Circuits (ICs); Height: 1.6mm; Temperature Range Low: -40°C; Temperature Range High: +125°C; Number Of Ethernet Channels: 1; Ipc Land Pattern Name: QFP50P2600X2600X160-176
TP1-TP8 = TestPoint: Value: TestPoint